# EAGLE design tf-3v3 (EAGLE 9.0.1)
PROJECT_NAME: TF360 3.3V Regulator
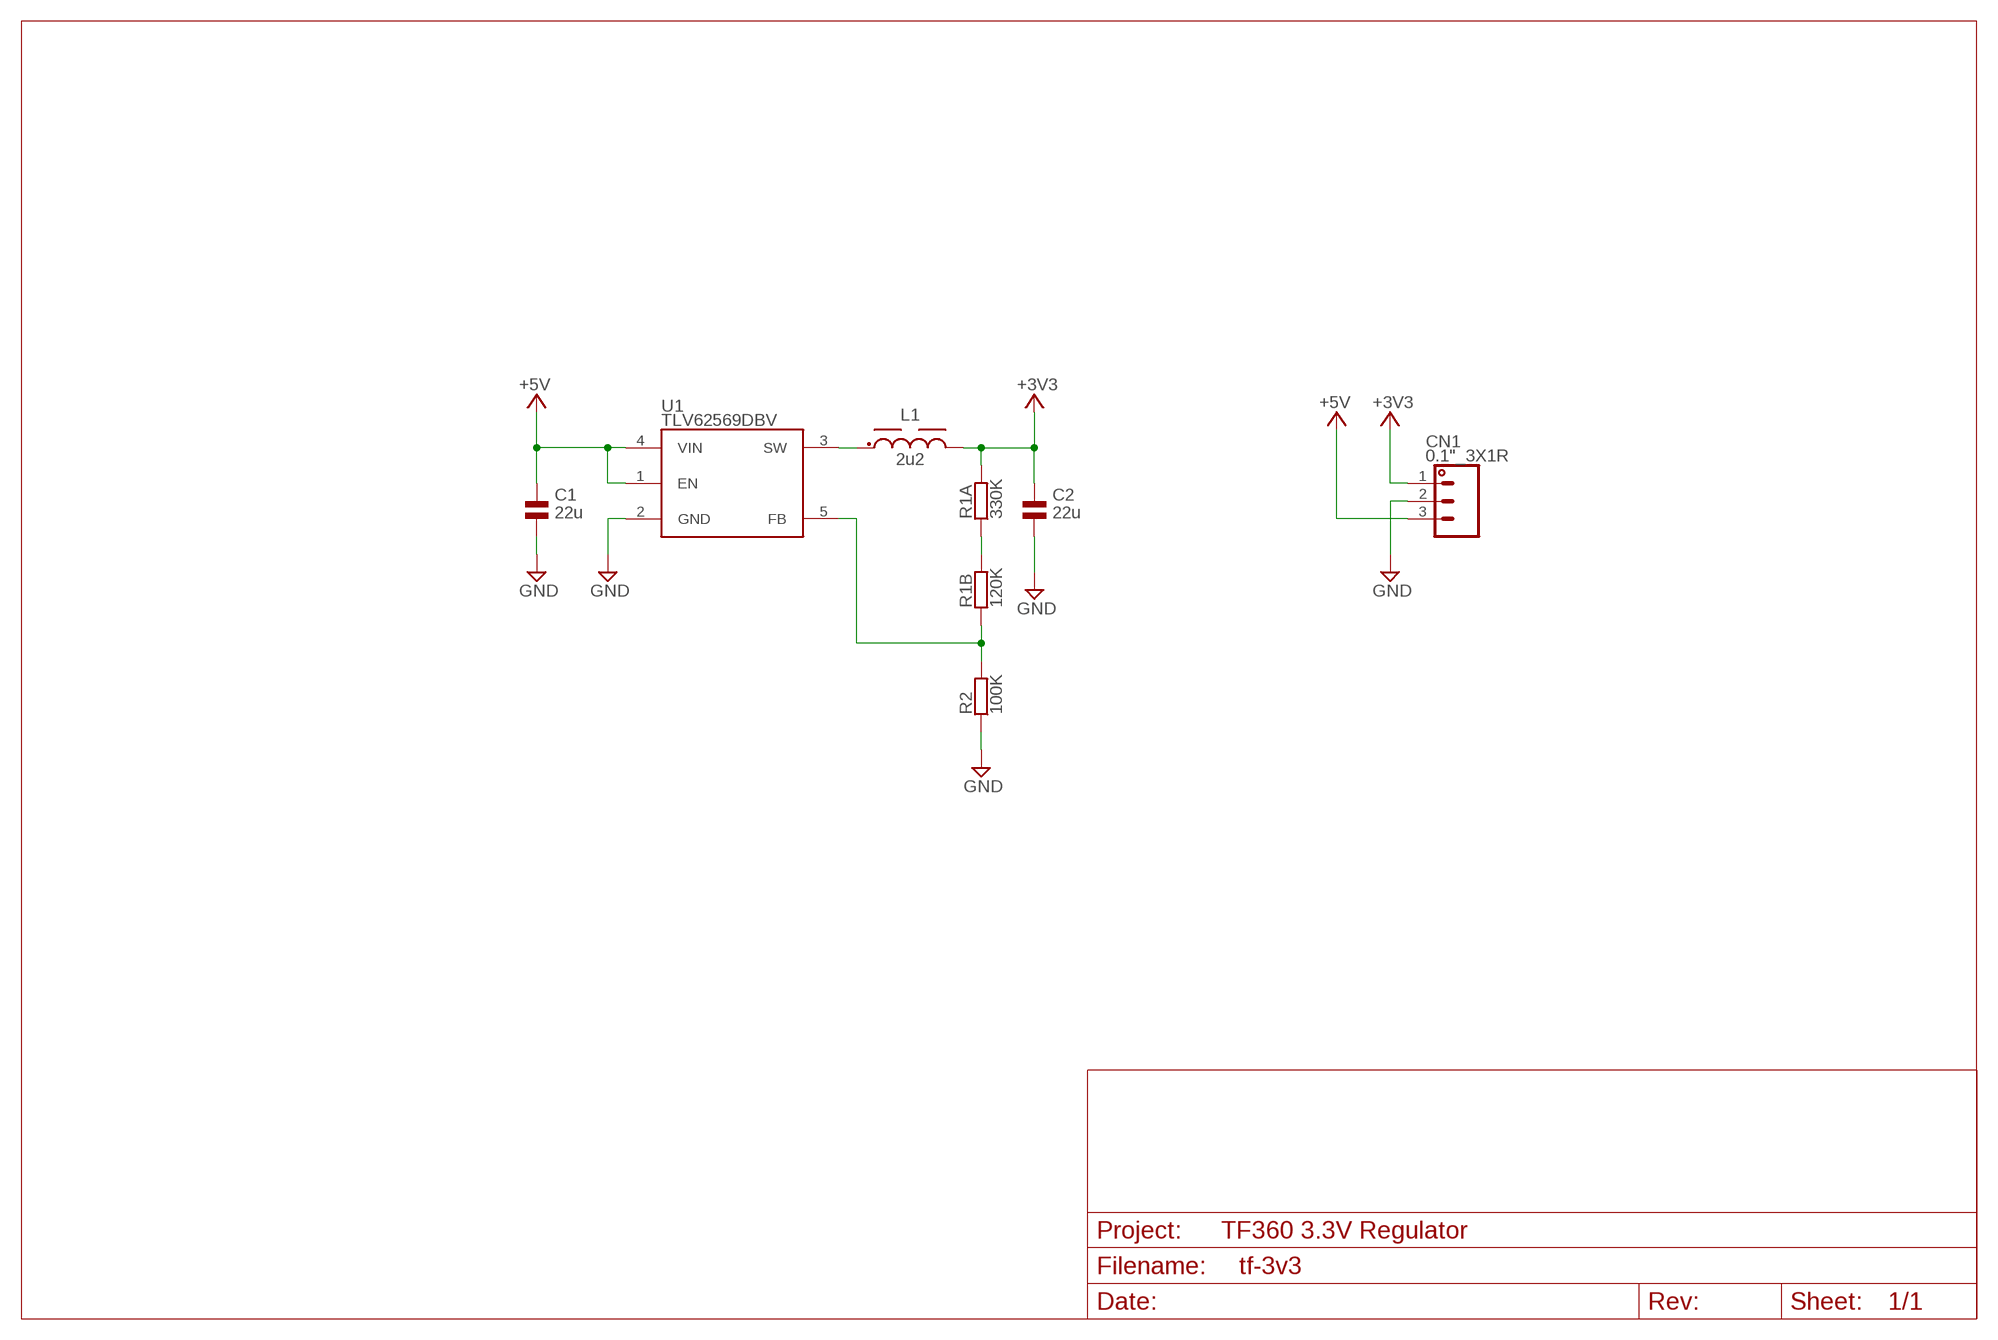
[diagram p0: schematic, sheet 1]

## Parts
C1  22u  CAP_NPOL-0805  [0805]
C2  22u  CAP_NPOL-0805  [0805]
CN1  0.1"_3X1R  [0.1"_3X1-ROUND]
L1  2u2  L-ANR6028  [ANR6028]
R1A  330K  RES-SMD_0603  [0603]
R1B  120K  RES-SMD_0603  [0603]
R2  100K  RES-SMD_0603  [0603]
U1  TLV62569DBV  [SOT23-5]

## Nets
+3V3: C2.1 CN1.1 L1.P$2 R1A.2
+5V: C1.1 CN1.3 U1.1(EN) U1.4(VIN)
FB: R1B.1 R2.2 U1.5(FB)
GND: C1.2 C2.2 CN1.2 R2.1 U1.2(GND)
N$1: R1A.1 R1B.2
SW: L1.P$1 U1.3(SW)

## Library data of the parts
C1 C2 = jc-passive:CAP_NPOL; LCSC_PART: C45783
CN1 = jc-connectors:0.1"_3X1
L1 = jc-inductors:L; LCSC_PART: C7427146
R1A = jc-passive:RES; LCSC_PART: C23137
R1B = jc-passive:RES; LCSC_PART: C25808
R2 = jc-passive:RES; LCSC_PART: C25803
U1 = jc-vreg:TLV62569; JLC_ROTATION: -90; LCSC_PART: C141836

## Board
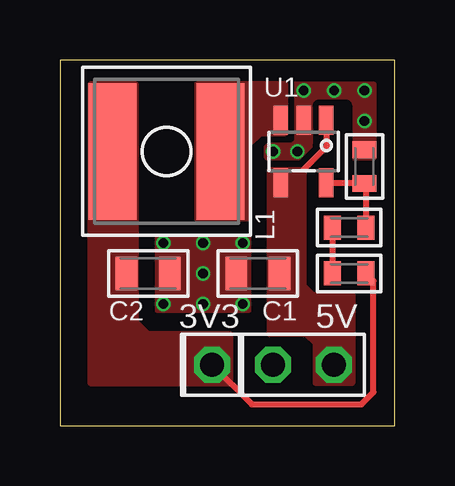
[diagram p1: board, top side]
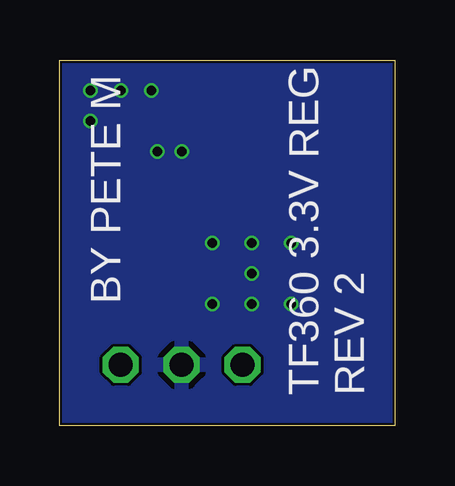
[diagram p2: board, bottom side, seen from below]

Size 13.97 x 15.24 mm. Coordinates in mm from the lower left corner, seen from the top.
Outline: 0,0 13.97,0 13.97,15.24 0,15.24 0,0
Copper layers (1*16): Top 0.035mm / dielectric 0.2mm / Bottom 0.035mm
Design rules "jlcpcb-2layers": minimum track width 3.5mil, minimum drill 0.2mm, track to track 5mil, track to pad 5mil, pad to pad 5mil, via to via 5mil, smd to smd 0mil, copper to edge 0.1mm, drill to drill 5mil, minimum pad ring 4mil, minimum via ring 4mil, stop-mask expansion 3mil, vias tented up to drill 100mil, thermal gap 10mil
tRestrict: 3 lines

### Footprints (pad centres in the part's own frame; a part is rotated, then mirrored left to right if it is on the bottom)
0805 = smd 0.9 x 1.4: 1 -0.9,0; 2 0.9,0
0.1"_3X1-ROUND = drill 1 octagon: 1 -2.54,0; 2 0,0; 3 2.54,0
ANR6028 = smd 2 x 5.7: P$1 -2.25,0; P$2 2.25,0
0603 = smd 0.7 x 1: 1 -0.7,0; 2 0.7,0
SOT23-5 = smd 0.6 x 1.2: 1 -0.95,-1.3; 2 0,-1.3; 3 0.95,-1.3; 4 0.95,1.3; 5 -0.95,1.3

### Placement (x,y rotation side)
C1  8.26,6.35 180 top
C2  3.68,6.35 0 top
CN1  8.89,2.54 0 top
L1  4.45,11.43 180 top
R1A  12.06,6.35 0 top
R1B  12.06,8.26 180 top
R2  12.7,10.79 270 top
U1  10.16,11.43 180 top

### Tracks (layer width: path | path; a pad name or v marks a point on that pad's centre or on a via)
+3V3
  Top 0.254: CN1.1 8,0.89 12.57,0.89 13.08,1.4 13.08,6.03 R1A.2
  pour Top (no thermals): 7.11,1.78 7.11,3.81 3.68,3.81 3.17,4.32 3.17,14.22 1.27,14.22 1.27,1.78
+5V
  Top 0.254: U1.1 11.11,11.62 10.16,10.67
  pour Top (no thermals): 8.76,10.67 10.16,10.67 10.16,5.84 10.54,5.46 12.19,5.46 12.19,1.78 10.67,1.78 10.67,3.43 10.29,3.81 8.76,3.81
FB
  Top 0.254: 11.37,10.13 U1.5 12.7,10.13 R2.2 12.77,10.1 R1B.1
GND  (via drill 0.4)
  other vias: 9.91,11.43 8.89,11.43 10.16,13.97 4.32,7.62 7.62,7.62 12.7,13.97 4.32,5.08 11.43,13.97 7.62,5.08 5.97,5.08 5.97,6.35 5.97,7.62 12.7,12.7
  pour Bottom: 0,0 13.97,0 13.97,15.24 0,15.24
  pour Top (no thermals): 4.06,7.87 4.06,4.83 7.87,4.83 7.87,7.87
  pour Top (isolate 0.254, rank 6, no thermals): 13.08,11.18 8.64,11.18 8.64,14.22 13.08,14.22
N$1
  Top 0.254: R1B.2 R1A.1
SW
  pour Top (no thermals): 7.87,11.68 8.38,12.19 9.4,12.19 9.4,14.22 5.71,14.22 5.71,8.64 7.87,8.64

### Text on the board
tPlace: 3V3 | 5V
bPlace: BY PETE M | REV 2 | TF360 3.3V REG